# Altium project BFO_metal detector2.PrjPcb
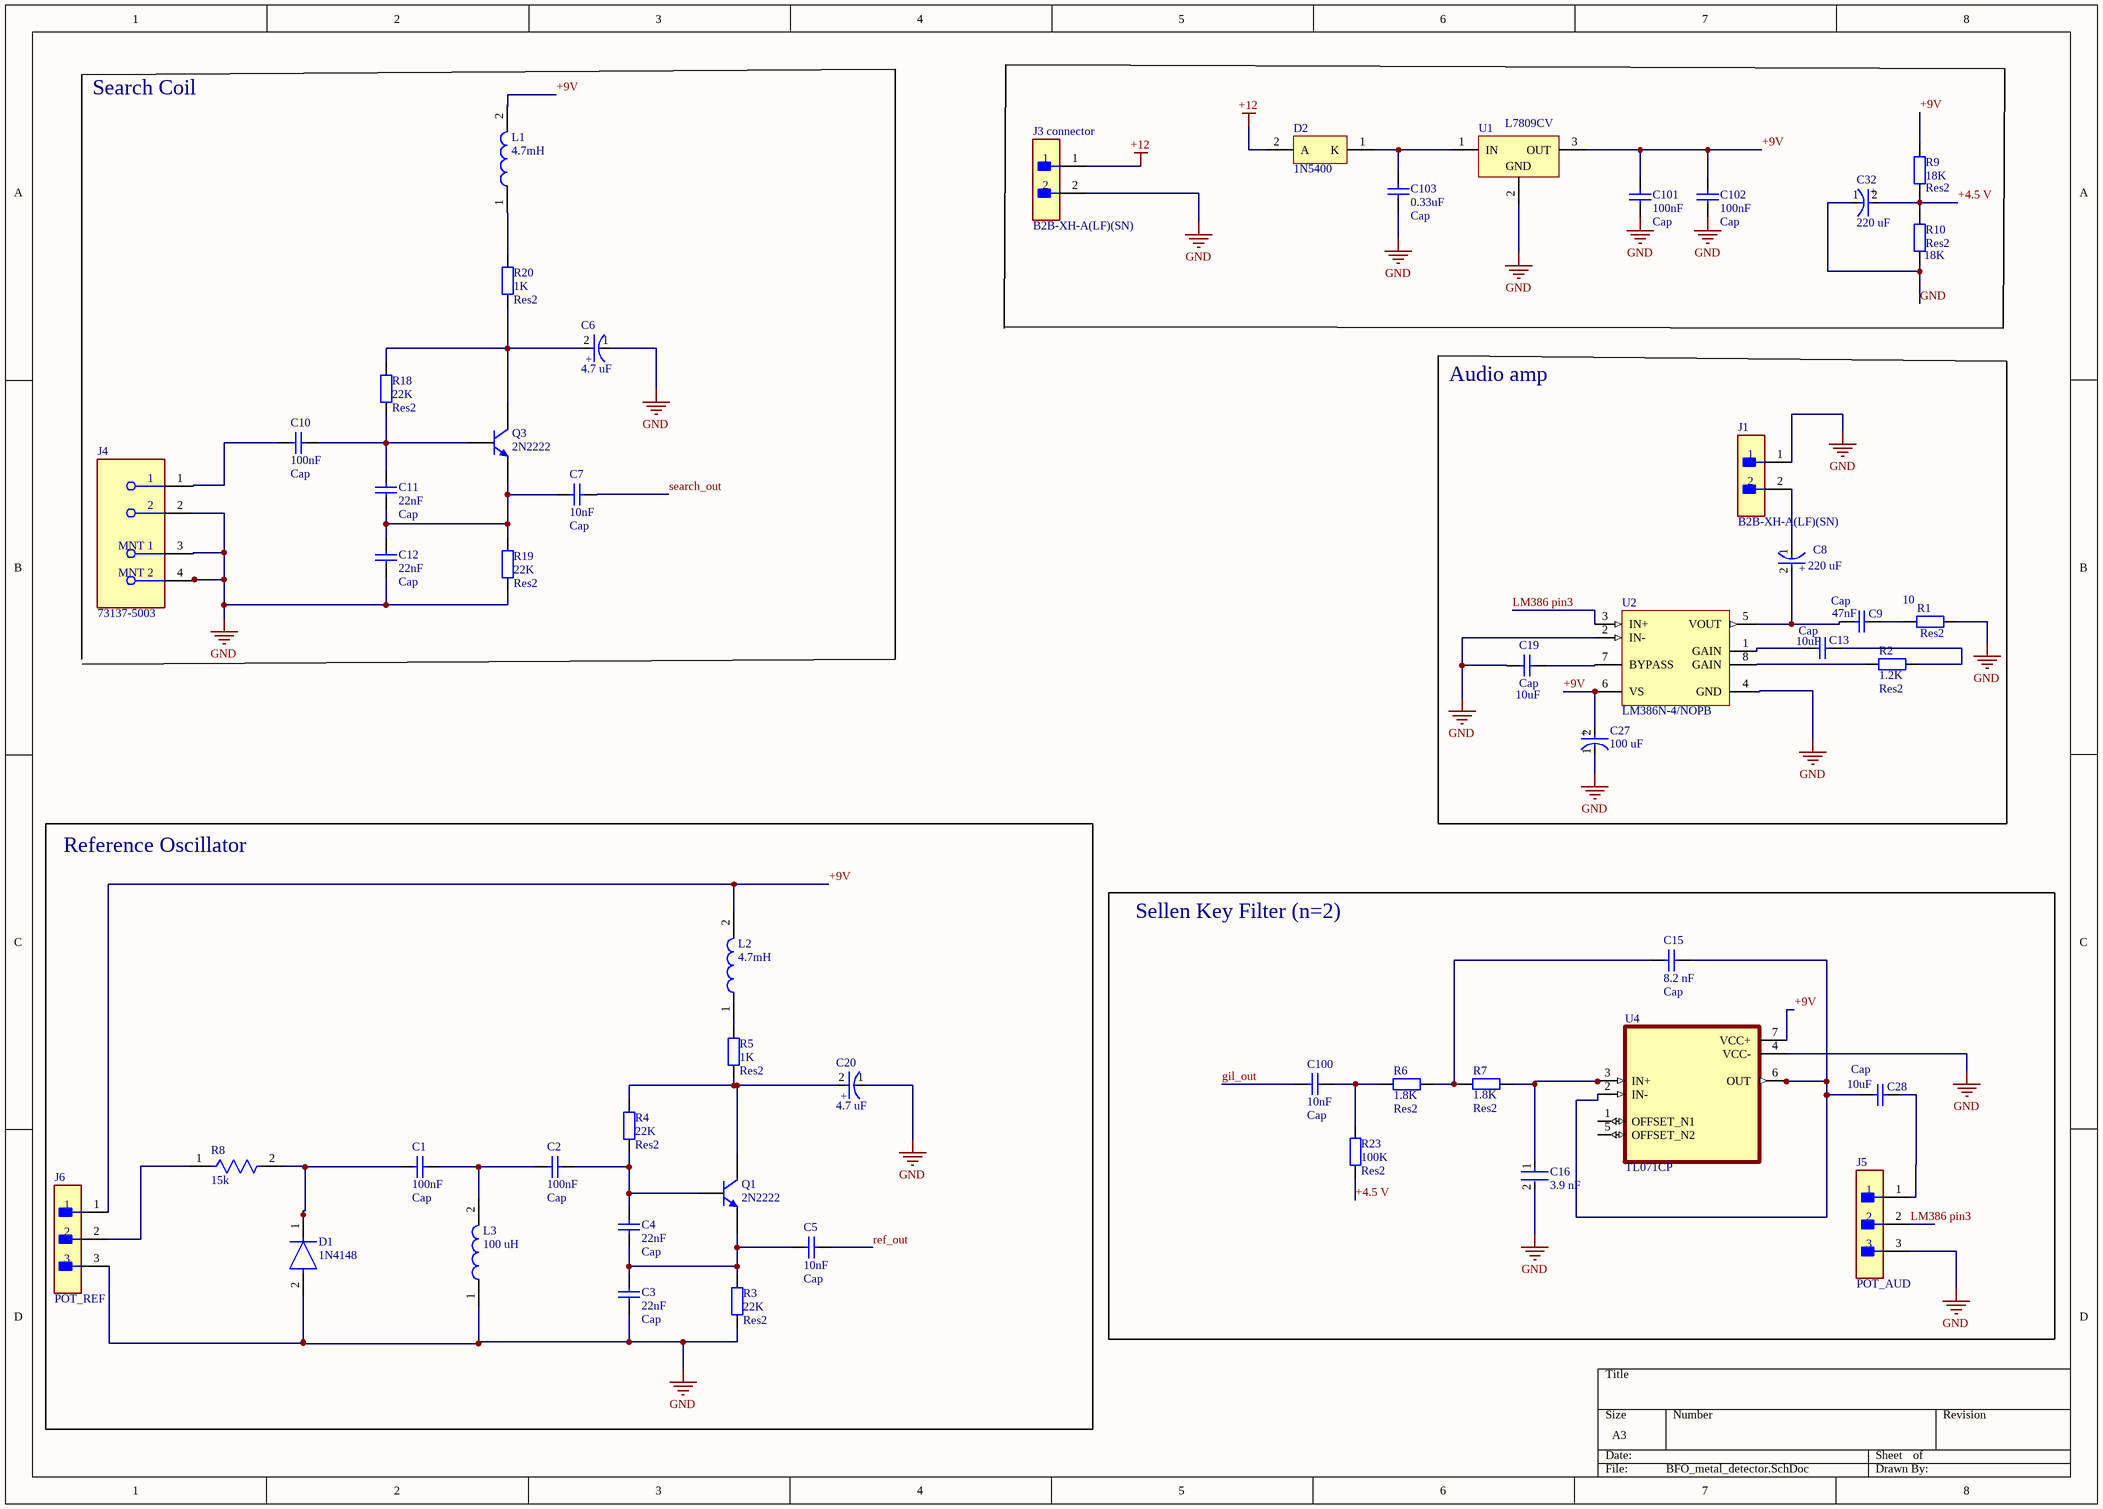
[diagram p0: BFO_metal_detector.SchDoc]
2 sheets, 94 parts. Net scope: global (net labels, ports and power ports of the same name join across sheets).
Board file: PCB1.PcbDoc
Sheets:
  BFO_metal_detector.SchDoc
  Mixer.SchDoc

## Sheet BFO_metal_detector.SchDoc
size A3; SheetNumber: 1; SheetTotal: 2; SPICEModelCacheBLAOBBYZ: <root> / <DocumentId>BLAOBBYZ</DocumentId> / </root>

### Parts
C1  Cap  value 100nF  [FP-RDE2M1-MFG]
C2  Cap  value 100nF  [FP-RDE2M1-MFG]
C3  Cap  value 22nF  [FP-RDE2M1-MFG]
C4  Cap  value 22nF  [FP-RDE2M1-MFG]
C5  Cap  value 10nF  [FP-RDE2M1-MFG]
C6  4.7 uF  [FP-UVK2D0R1MED1TD-MFG]
C7  Cap  value 10nF  [FP-RDE2M1-MFG]
C8  220 uF  [FP-RAD-TH-D_12_5_0_5-L_25-MFG]
C9  Cap  value 47nF  [FP-RDE2M1-MFG]
C10  Cap  value 100nF  [FP-RDE2M1-MFG]
C11  Cap  value 22nF  [FP-RDE2M1-MFG]
C12  Cap  value 22nF  [FP-RDE2M1-MFG]
C13  Cap  value 10uF  [FP-RDE2M1-MFG]
C15  Cap  value 8.2 nF  [FP-RDE2M1-MFG]
C16  3.9 nF  [FP-RCE1A2-MFG]
C19  Cap  value 10uF  [FP-RDE2M1-MFG]
C20  4.7 uF  [FP-UVK2D0R1MED1TD-MFG]
C27  100 uF  [FP-RAD-TH-D_6_3_0_5-L_11-MFG]
C28  Cap  value 10uF  [FP-RDE2M1-MFG]
C32  220 uF  [FP-RAD-TH-D_12_5_0_5-L_25-MFG]
C100  Cap  value 10nF  [FP-RDE2M1-MFG]
C101  Cap  value 100nF  [FP-RDE2M1-MFG]
C102  Cap  value 100nF  [FP-RDE2M1-MFG]
C103  Cap  value 0.33uF  [FP-RDE2M1-MFG]
D1  1N4148  [FP-017AG-MFG]
D2  1N5400  [ONSC-AXIAL_LEAD-2-267-05_V]
J1  B2B-XH-A(LF)(SN)  [FP-B2B-XH-A_LF_SN-MFG]
J3_connector  B2B-XH-A(LF)(SN)  [FP-B2B-XH-A_LF_SN-MFG]
J4  73137-5003  [FP-73137-5003-MFG]
J5  POT_AUD  [FP-B3B-EH_LF_SN-MFG]
J6  POT_REF  [FP-B3B-EH_LF_SN-MFG]
L1  4.7mH  [INDAD2520W80L920D400]
L2  4.7mH  [INDAD2520W80L920D400]
L3  100 uH  [INDAD2520W80L920D400]
Q1  2N2222  [TO-226-AA]
Q3  2N2222  [TO-226-AA]
R1  Res2  value 10  [FP-MRS25-MFG]
R2  Res2  value 1.2K  [FP-MRS25-MFG]
R3  Res2  value 22K  [FP-MRS25-MFG]
R4  Res2  value 22K  [FP-MRS25-MFG]
R5  Res2  value 1K  [FP-MRS25-MFG]
R6  Res2  value 1.8K  [FP-MRS25-MFG]
R7  Res2  value 1.8K  [FP-MRS25-MFG]
R8  15k  [FP-MRS25-MFG]
R9  Res2  value 18K  [FP-MRS25-MFG]
R10  Res2  value 18K  [FP-MRS25-MFG]
R18  Res2  value 22K  [FP-MRS25-MFG]
R19  Res2  value 22K  [FP-MRS25-MFG]
R20  Res2  value 1K  [FP-MRS25-MFG]
R23  Res2  value 100K  [FP-MRS25-MFG]
U1  L7809CV  [TO220]
U2  LM386N-4/NOPB  [P0008A]
U4  TL071CP  [DIP794W45P254L959H508Q8]

### Blocks framed on the sheet
Audio amp: C8 C9 C13 C19 C27 J1 R1 R2 U2
Reference Oscillator: C1-C5 C20 D1 J6 L2 L3 Q1 R3-R5 R8
Sellen Key Filter (n=2): C15 C16 C28 C100 J5 R6 R7 R23 U4

### Nets
+12: D2.2(A) J3_connector.1
GND: C3.1 C6.1(C) C12.1 C16.2 C19.2 C20.1(C) C27.1(C) C32.1(C) C101.1 C102.1 C103.1 D1.2(A) J1.1 J3_connector.2 J4.2 J4.3(MNT_1) J4.4(MNT_2) J5.3 J6.3 L3.1 R1.1 R3.1 R10.2 R19.1 U1.2(GND) U2.2(IN-) U2.4(GND) U4.4(VCC-)
+4.5 V: C32.2(A) R9.2 R10.1 R23.1
+9V: C27.2(A) C101.2 C102.2 J6.1 L1.2 L2.2 R9.1 U1.3(OUT) U2.6(VS) U4.7(VCC+)
gil_out: C100.1
LM386 pin3: J5.2 U2.3(IN+)
ref_out: C5.2
search_out: C7.2
NetC1_1: C1.1 D1.1(C) R8.2
NetC1_2: C1.2 C2.1 L3.2
NetC2_2: C2.2 C4.2 Q1.2(B) R4.1
NetC3_2: C3.2 C4.1 C5.1 Q1.3(E) R3.2
NetC6_2: C6.2(A) Q3.1(C) R18.2 R20.1
NetC7_1: C7.1 C11.1 C12.2 Q3.3(E) R19.2
NetC8_1: C8.1(C) J1.2
NetC8_2: C8.2(A) C9.2 U2.5(VOUT)
NetC9_1: C9.1 R1.2
NetC10_1: C10.1 J4.1
NetC10_2: C10.2 C11.2 Q3.2(B) R18.1
NetC13_1: C13.1 R2.1
NetC13_2: C13.2 U2.1(GAIN)
NetC15_1: C15.1 R6.1 R7.2
NetC15_2: C15.2 C28.2 U4.2(IN-) U4.6(OUT)
NetC16_1: C16.1 R7.1 U4.3(IN+)
NetC19_1: C19.1 U2.7(BYPASS)
NetC20_2: C20.2(A) Q1.1(C) R4.2 R5.1
NetC28_1: C28.1 J5.1
NetC100_2: C100.2 R6.2 R23.2
NetC103_2: C103.2 D2.1(K) U1.1(IN)
NetJ6_2: J6.2 R8.1
NetL1_1: L1.1 R20.2
NetL2_1: L2.1 R5.2
NetR2_2: R2.2 U2.8(GAIN)

Not connected (* = marked no-connect by the designer): U4 1(OFFSET_N1) 5(OFFSET_N2)

### Notes on the sheet
- Search Coil
- (in symbol CMP-00267-12791902-1) +
- (in symbol CMP-05427-000141-1) +
- (in symbol CMP-05427-000330-1) +

### Library data of the parts
C1-C5 C7 C9-C13 C15 C19 C28 C100-C103 = Cap: Capacitor; Published: 8-Jun-2000; LatestRevisionDate: 17-Jul-2002; LatestRevisionNote: Re-released for DXP Platform.; PackageReference: RAD-0.3; Publisher: Altium Limited; PackageDescription: Radial Cap, Thru-Hole; 2 Leads; 0.3 in Pin Spacing
C6 C20 = CMP-00267-12791902-1: UVK2D0R1MED1TD Radial Can ALUMINUM ELECTROLYTIC CAPACITOR UVK 200V 0.1muF ±20% 0.248Dia 6.30mm; Dielectric Material: Aluminium; Leakage Current: 42µA; Ripple Current: 2.1mA; Life (Hours): 2000hours; Capacitance: 100nF; RoHS: Compliant; Max Operating Temperature: 85°C; Voltage Rating: 200V; Diameter: 6.3mm; NexarPartId: 12791902; Mount: Through Hole; Tolerance: 20%; Height - Seated (Max): 12.4968mm; Lead Pitch: 2.4892mm; Dissipation Factor: 20%; Height: 11mm; Voltage Rating (DC): 200V; Case/Package: Radial; Min Operating Temperature: -40°C
C8 C32 = CMP-05427-000330-1: Aluminum Electrolytic Capacitors (Radial Lead Type) 220uF ±20% 100V; RoHS Compliant: Yes
C16 = CMP-06035-043805-1: Cap Ceramic 47nF 100V X7R ±10% Radial 2.5mm +125°C Automotive Ammo Pack; Lead/Base Style: Straight; Lead Diameter: 0.5mm; Tolerance: 10%; Capacitance: 47nF; Voltage Rating (DC): 100V; Lead Pitch: 0.098inch; Dielectric: X7R; Ratings: AEC-Q200; Packaging: Tape and Reel; Resistor Type: Ceramic; Mount: Through Hole; Height - Seated (Max): 0.138inch; Termination: Radial; Voltage Rating: 100V; Min Operating Temperature: -55°C; Width: 0.098inch; Height: 3.5mm; Max Operating Temperature: 125°C; Length: 0.157inch; Package Quantity: 2000; Case/Package: Radial
C27 = CMP-05427-000141-1: Aluminum Electrolytic Capacitors (Radial Lead Type) AEC-Q200 Qualified 100uF ±20% 25V; Lead Diameter: 0.5mm; Life (Hours): 1000Hour; Ripple Current: 130mA; Lead/Base Style: Straight; Construction: RADIAL; Radiation Hardening: No; Packaging: Ammo Pack; Termination: Radial; Mount: Through Hole; Lead Pitch: 2.5mm; Tolerance: 20%; Height - Seated (Max): 0.48inch; Height: 11.2mm; Max Operating Temperature: 105°C; Length: 11.2mm; Diameter: 6.3mm; RoHS Compliant: Yes; Voltage Rating: 25V; Min Operating Temperature: -55°C; Package Quantity: 2000; Capacitance: 100uF; Width: 6.3mm; Voltage Rating (DC): 25V; Series: NHG; Contact Plating: Tin; Case/Package: Radial
D1 = CMP-07163-000046-1: DIODE GEN PURP 100V 200MA DO35; Forward Voltage: 1V; Max Power Dissipation: 500mW; Max Reverse Current: 5uA; Forward Current: 300mA; Current: 4A; Reverse Recovery Time: 4ns; Element Configuration: Single; Outside Diameter: 1.85mm; Capacitance: 4pF; Polarity: Standard; Max Forward Surge Current (Ifsm): 1A; Reverse Voltage: 100V; Output Current: 200mA; Average Rectified Current: 200mA; Diameter: 1.91mm; Max Repetitive Reverse Voltage (Vrrm): 100V; Current Rating: 200mA; Case/Package: DO-35; Lead Free: Lead Free; Number of Pins: 2; Recovery Time: 4ns; Packaging: Bulk; Contact Plating: Tin; Voltage: 100V; Mount: Through Hole; Max Surge Current: 4A; Package Quantity: 2000; Width: 1.91mm; Max Reverse Voltage (DC): 100V; Length: 4.56mm; Radiation Hardening: No; Power Dissipation: 500mW; Voltage Rating (DC): 100V; Peak Non-Repetitive Surge Current: 4A; REACH SVHC: No SVHC; Height: 4.56mm; Max Operating Temperature: 175°C; Series: -; Weight: 0.01lb; Min Operating Temperature: -65°C
D2 = CMP-0902-00082-1: Standard Recovery Rectifier, 2-Pin Axial_Lead, Pb-Free, Bulk Box; Manufacturer: On Semiconductor; VRRM Max (V): 50; IFSM Max (A): 200; IO(rec) Max (A): 3; ComponentLink1URL: http://www.onsemi.com/; DatasheetVersion: Rev. 10; RoHS: TRUE; PackageReference: AXIAL_LEAD-2-267-05; ComponentLink3URL: http://www.onsemi.com/pub_link/Collateral/267-05.PDF; Type: Standard Recovery; ComponentLink1Description: Manufacturer URL; PackageVersion: Rev. G, 06/2000; ComponentLink2Description: Datasheet; PackageDescription: 2-Pin, Axial Lead, Diameter 5.05 mm; ComponentLink2URL: http://www.onsemi.com/pub_link/Collateral/1N5400-D.PDF; Packing: Bulk Box; Mounting Technology: Through Hole; PartNumber: 1N5400; ComponentLink3Description: Package Specification
J1 J3_connector = CMP-2000-05888-3: CONN HEADER VERT 2POS 2.5MM; Current Rating: 3A; Voltage Rating: 250V; Number of Contacts: 2; Contact Resistance: 20mR; Wire/Cable Gauge: 22AWG; Insulation Resistance: 1GR; Connector Type: Male Pin; Packaging: Bulk; Contact Material: Brass; Lead Free: Lead Free; Orientation: Straight; Contact Plating: Tin; Max Current Rating: 3A; Termination: Solder; Fastening Type: Detent; Depth: 5.75mm; Housing Material: Polyamide; REACH SVHC: No SVHC; Series: XH; Voltage Rating (AC): 250V; Number of Positions: 2; Color: Natural; Contact Type: Male Pin; Max Voltage Rating (DC): 250V; Pitch: 2.5mm; Lead Pitch: 2.5mm; Mount: Through Hole; Max Operating Temperature: 85°C; Length: 7.4mm; Max Voltage Rating (AC): 250V; Min Operating Temperature: -25°C; Number of Rows: 1; Housing Color: White
J4 = CMP-00257-00776508-1: 73137-5003 Connector BNC Female 0Hz To 2GHz 50 Ohm Solder Right Angle Through Hole Gold Tray; NexarPartId: 776508; Manufacturer Lifecycle Status: ACTIVE; Body Plating: Nickel; Polarity: Normal; Connector Type: PCB; Number of Contacts: 1; Impedance: 50Ω; Body Material: PBT, Polybutylene; Voltage Rating: 500V; Dielectric Material: Polypropylene; Min Operating Temperature: -20°C; Orientation: Right Angle, Straight; Termination: Solder; Gender: Female; RoHS: Compliant; REACH SVHC: No SVHC; Lifecycle Status: Production; Country of Origin: US; Contact Plating: Gold; Depth: 14.76mm; Lead Free: Lead Free; Mount: Through Hole; Length: 35.18mm; Max Operating Temperature: 70°C; Frequency: 2GHz; Radiation Hardening: No; Height: 13.2mm; Plating: Nickel; Contact Material: Bronze, Gold, Nickel, Tin; Insulation Material: Polyester; Halogen Free: Low Halogen
J5 J6 = CMP-17439-000692-1: 3 Position Single Row 2.5 mm Press Fit Through Hole Shrouded Pin Header; Voltage Rating: 250V; Pitch: 2.5mm; Current Rating: 3A; Number of Positions: 3; Termination: Solder; Contact Material: Brass; Series: EH; Mount: Through Hole; Number of Contacts: 3; Number of Rows: 1; Lead Free: Lead Free; Orientation: Straight
L1-L3 = B78108S1153K000: Inductor; Manufacturer_Name: TDK; Datasheet Link: https://product.tdk.com/system/files/dam/doc/product/inductor/inductor/lead/data_sheet/30/db/ind_2008/b78108_148s.pdf; Manufacturer_Part_Number: B78108S1153K000
Q1 Q3 = NPN: NPN Bipolar Transistor; Published: 8-Jun-2000; LatestRevisionDate: 17-Jul-2002; LatestRevisionNote: Re-released for DXP Platform.; PackageReference: TO-226-AA; Publisher: Altium Limited; PackageDescription: TO, Flat Index; 3 In-Line, Axial Leads; Body Dia. 4.8mm; Leads 0.55 x 0.51 mm (max); Code_JEDEC: TO-226-AA
R1-R7 R9 R10 R18-R20 R23 = Res2: Resistor; Published: 8-Jun-2000; LatestRevisionDate: 17-Jul-2002; LatestRevisionNote: Re-released for DXP Platform.; PackageReference: AXIAL-0.4; Publisher: Altium Limited; PackageDescription: Axial Device, Thru-Hole; 2 Leads; 0.4 in Pin Spacing
R8 = CMP-00030-42632392-1: MRS25000C1002FCT00 Resistor, 10 kOhm, ± 1%, 600 mW, Axial Leaded, Metal Film (Thin Film), Professional; Power Rating: 600mW; Voltage Rating (DC): 350V; Lead Length: 26mm; Resistance: 10kΩ; Temperature Coefficient: 50ppm/°C; Termination: Axial; Number of Terminations: 2; Diameter: 2.5mm; Composition: Metal Film, Thin Film; Number of Pins: 2; Length: 6.5mm; Military Standard: Not; RoHS: Compliant; NexarPartId: 42632392; Width: 2.5mm; Radiation Hardening: No; Voltage Rating: 350V; Max Power Dissipation: 600mW; Min Operating Temperature: -55°C; Lead Free: Lead Free; Max Operating Temperature: 155°C; Tolerance: 1%; Schedule B: 8533210090, 8533210090; Contact Plating: Tin; Mount: Through Hole; REACH SVHC: Unknown; Case/Package: Conformal
U1 = CMP-0244-00459-1: Positive Voltage Regulator, 9V, 3-Pin TO-220; ComponentLink3URL: http://www.st.com/internet/com/TECHNICAL_RESOURCES/TECHNICAL_LITERATURE/PACKAGE_INFORMATION/CD00004649.pdf; ComponentLink2Description: Datasheet; DatasheetVersion: 16/11/2011; PackageVersion: ver3.0; PackageDescription: TO, Thru-Hole, Vertical, Heatsink Mounted; 3 In-Line Leads; Pitch 2.54 mm; ComponentLink3Description: Package Specification; ComponentLink2URL: http://www.st.com/internet/com/TECHNICAL_RESOURCES/TECHNICAL_LITERATURE/DATASHEET/CD00000444.pdf; ComponentLink1URL: http://www.st.com; ComponentLink1Description: Manufacturer URL; PackageReference: TO220
U2 = CMP-0057-00047-4: Low Voltage Audio Power Amplifier, 8-pin MDIP, Pb-Free; Manufacturer: Texas Instruments; PowerWise: N; CompType: Audio IC; PackageTopMarking: NSUZXYTTE#*LM*386N-4; PackageDescription: MDIP, .365 x .250 x .130in, 8 Lead, .100in Pitch; ComponentLink1Description: Datasheet URL; PinCount: 8; ComponentLink1URL: http://www.ti.com/general/docs/lit/getliterature.tsp?genericPartNumber=LM386&fileType=pdf; PackageReference: P0008A; RoHS: Y; Code_JEDEC: MS-001-BA
U4 = TL071CP: Single, 30-V, 3-MHz, high slew rate (13-V/Âµs), In to V+, JFET-input op amp; MF: Texas Instruments; SnapEDA_Link: https://www.snapeda.com/parts/TL071CP/Texas+Instruments/view-part/?ref=snap; Package: PDIP-8 Texas; Value: *; MP: TL071CP; Check_prices: https://www.snapeda.com/parts/TL071CP/Texas+Instruments/view-part/?ref=eda

## Sheet Mixer.SchDoc
size A3; SheetNumber: 2; SheetTotal: 2; SPICEModelCacheLUFZZWDB: <root> / <DocumentId>LUFZZWDB</DocumentId> / </root>
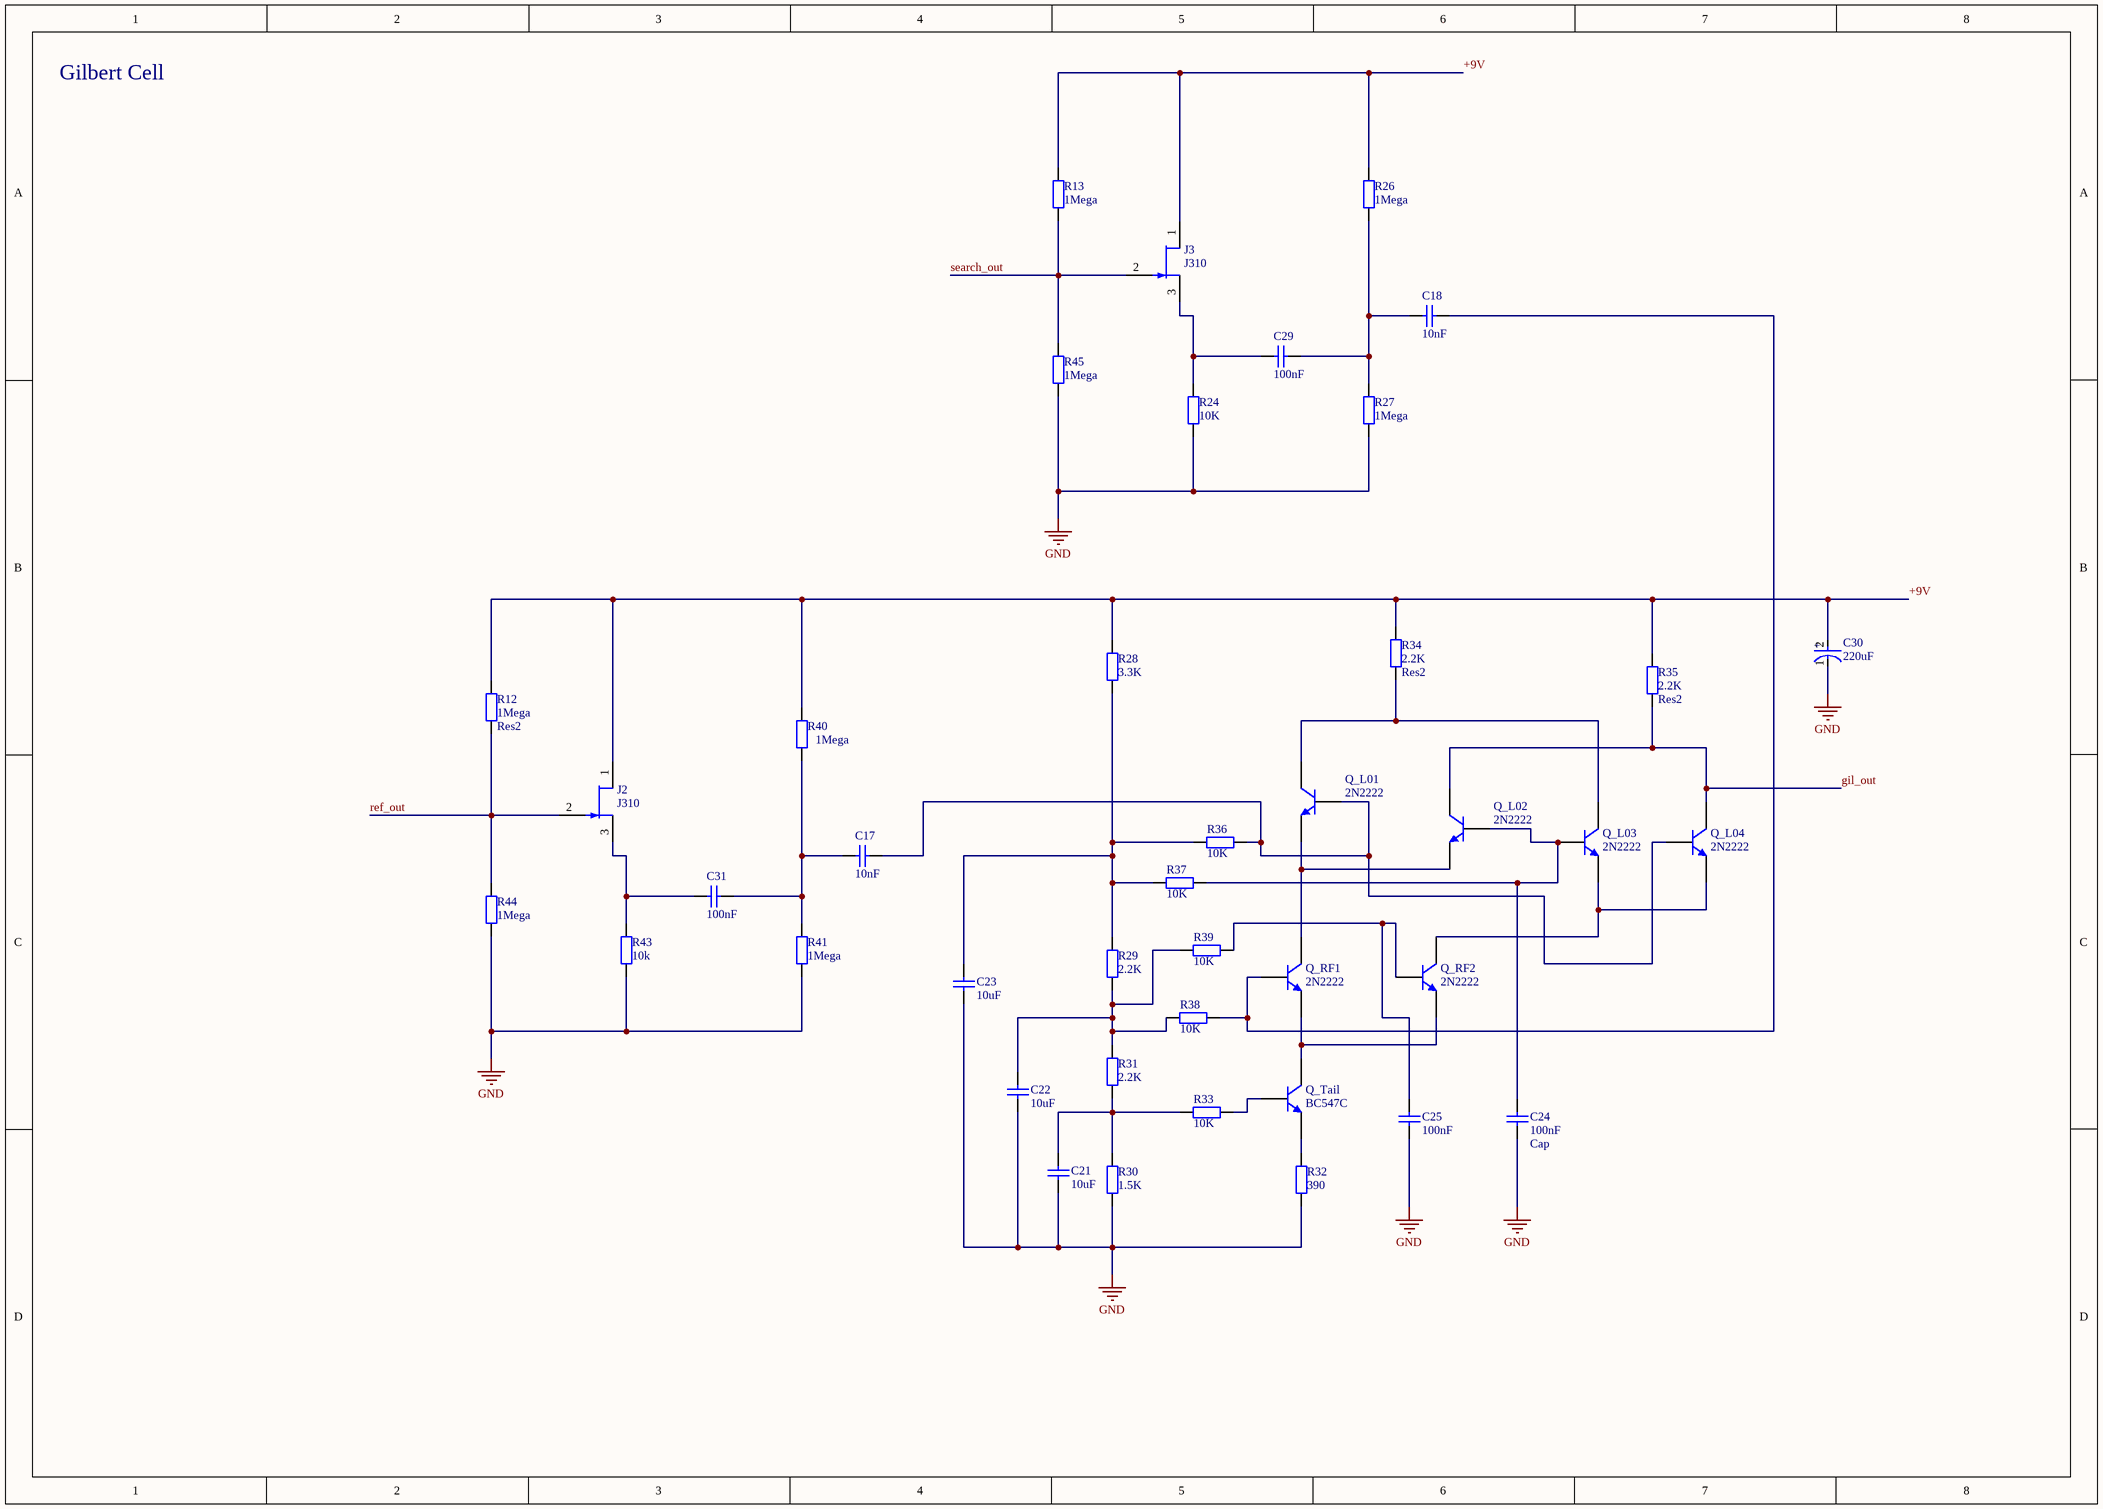
[diagram p1: Mixer.SchDoc]

### Parts
C17  value 10nF  [FP-RDE2M1-MFG]  (hidden comment: Cap)
C18  value 10nF  [FP-RDE2M1-MFG]  (hidden comment: Cap)
C21  value 10uF  [FP-RDE2M1-MFG]  (hidden comment: Cap)
C22  value 10uF  [FP-RDE2M1-MFG]  (hidden comment: Cap)
C23  value 10uF  [FP-RDE2M1-MFG]  (hidden comment: Cap)
C24  Cap  value 100nF  [FP-RDE2M1-MFG]
C25  value 100nF  [FP-RDE2M1-MFG]  (hidden comment: Cap)
C29  value 100nF  [FP-RDE2M1-MFG]  (hidden comment: Cap)
C30  220uF  [FP-RAD-TH-D_12_5_0_5-L_25-MFG]
C31  value 100nF  [FP-RDE2M1-MFG]  (hidden comment: Cap)
J2  J310  [TO-254-AA]
J3  J310  [TO-254-AA]
Q_L01  2N2222  [TO-226-AA]
Q_L02  2N2222  [TO-226-AA]
Q_L03  2N2222  [TO-226-AA]
Q_L04  2N2222  [TO-226-AA]
Q_RF1  2N2222  [TO-226-AA]
Q_RF2  2N2222  [TO-226-AA]
Q_Tail  BC547C  [TO-226-AA]
R12  Res2  value 1Mega  [FP-MRS25-MFG]
R13  value 1Mega  [FP-MRS25-MFG]  (hidden comment: Res2)
R24  value 10K  [FP-MRS25-MFG]  (hidden comment: Res2)
R26  value 1Mega  [FP-MRS25-MFG]  (hidden comment: Res2)
R27  value 1Mega  [FP-MRS25-MFG]  (hidden comment: Res2)
R28  value 3.3K  [FP-MRS25-MFG]  (hidden comment: Res2)
R29  value 2.2K  [FP-MRS25-MFG]  (hidden comment: Res2)
R30  value 1.5K  [FP-MRS25-MFG]  (hidden comment: Res2)
R31  value 2.2K  [FP-MRS25-MFG]  (hidden comment: Res2)
R32  value 390  [FP-MRS25-MFG]  (hidden comment: Res2)
R33  value 10K  [FP-MRS25-MFG]  (hidden comment: Res2)
R34  Res2  value 2.2K  [FP-MRS25-MFG]
R35  Res2  value 2.2K  [FP-MRS25-MFG]
R36  value 10K  [FP-MRS25-MFG]  (hidden comment: Res2)
R37  value 10K  [FP-MRS25-MFG]  (hidden comment: Res2)
R38  value 10K  [FP-MRS25-MFG]  (hidden comment: Res2)
R39  value 10K  [FP-MRS25-MFG]  (hidden comment: Res2)
R40  value 1Mega  [FP-MRS25-MFG]  (hidden comment: Res2)
R41  value 1Mega  [FP-MRS25-MFG]  (hidden comment: Res2)
R43  value 10k  [FP-MRS25-MFG]  (hidden comment: Res2)
R44  value 1Mega  [FP-MRS25-MFG]  (hidden comment: Res2)
R45  value 1Mega  [FP-MRS25-MFG]  (hidden comment: Res2)

### Nets
GND: C21.1 C22.1 C23.1 C24.1 C25.1 C30.1(C) R24.1 R27.1 R30.1 R32.1 R41.1 R43.1 R44.1 R45.1
+9V: C30.2(A) J2.1(D) J3.1(D) R12.2 R13.2 R26.2 R28.2 R34.2 R35.2 R40.2
gil_out: Q_L02.1(C) Q_L04.1(C) R35.1
ref_out: J2.2(G) R12.1 R44.2
search_out: J3.2(G) R13.1 R45.2
NetC17_1: C17.1 C31.2 R40.1 R41.2
NetC17_2: C17.2 Q_L01.2(B) Q_L04.2(B) R36.2
NetC18_1: C18.1 C29.2 R26.1 R27.2
NetC18_2: C18.2 Q_RF1.2(B) R38.2
NetC21_2: C21.2 R30.2 R31.1 R33.1
NetC22_2: C22.2 R29.1 R31.2 R38.1 R39.1
NetC23_2: C23.2 R28.1 R29.2 R36.1 R37.1
NetC24_2: C24.2 Q_L02.2(B) Q_L03.2(B) R37.2
NetC25_2: C25.2 Q_RF2.2(B) R39.2
NetC29_1: C29.1 J3.3(S) R24.2
NetC31_1: C31.1 J2.3(S) R43.2
NetQ_L01_1: Q_L01.1(C) Q_L03.1(C) R34.1
NetQ_L01_3: Q_L01.3(E) Q_L02.3(E) Q_RF1.1(C)
NetQ_L03_3: Q_L03.3(E) Q_L04.3(E) Q_RF2.1(C)
NetQ_RF1_3: Q_RF1.3(E) Q_RF2.3(E) Q_Tail.1(C)
NetQ_Tail_2: Q_Tail.2(B) R33.2
NetQ_Tail_3: Q_Tail.3(E) R32.2

### Notes on the sheet
- Gilbert Cell
- (in symbol CMP-05427-000330-1) +

### Library data of the parts
C17 C18 C21-C25 C29 C31 = Cap: Capacitor; Published: 8-Jun-2000; LatestRevisionDate: 17-Jul-2002; LatestRevisionNote: Re-released for DXP Platform.; PackageReference: RAD-0.3; Publisher: Altium Limited; PackageDescription: Radial Cap, Thru-Hole; 2 Leads; 0.3 in Pin Spacing
C30 = CMP-05427-000330-1: as C8 on sheet BFO_metal_detector; RoHS Compliant: Yes
J2 J3 = JFET-N: N-Channel JFET; pin to pad: 2>3 3>2; Published: 8-Jun-2000; LatestRevisionDate: 17-Jul-2002; LatestRevisionNote: Re-released for DXP Platform.; PackageReference: TO-254-AA; Publisher: Altium Limited; Code_JEDEC: TO-254-AA
Q_L01 Q_L02 Q_L03 Q_L04 Q_RF1 Q_RF2 Q_Tail = NPN: NPN Bipolar Transistor; Published: 8-Jun-2000; LatestRevisionDate: 17-Jul-2002; LatestRevisionNote: Re-released for DXP Platform.; PackageReference: TO-226-AA; Publisher: Altium Limited; PackageDescription: TO, Flat Index; 3 In-Line, Axial Leads; Body Dia. 4.8mm; Leads 0.55 x 0.51 mm (max); Code_JEDEC: TO-226-AA
R12 R13 R24 R26-R41 R43-R45 = Res2: Resistor; Published: 8-Jun-2000; LatestRevisionDate: 17-Jul-2002; LatestRevisionNote: Re-released for DXP Platform.; PackageReference: AXIAL-0.4; Publisher: Altium Limited; PackageDescription: Axial Device, Thru-Hole; 2 Leads; 0.4 in Pin Spacing

## Nets that join several sheets
GND: BFO_metal_detector (28 pins), Mixer (14 pins)
+9V: BFO_metal_detector (10 pins), Mixer (10 pins)
gil_out: BFO_metal_detector (C100.1), Mixer (Q_L02.1 Q_L04.1 R35.1)
ref_out: BFO_metal_detector (C5.2), Mixer (J2.2 R12.1 R44.2)
search_out: BFO_metal_detector (C7.2), Mixer (J3.2 R13.1 R45.2)